# Altium schematic sheet STLink.SchDoc
size A4; SheetNumber: 3; SheetTotal: 7
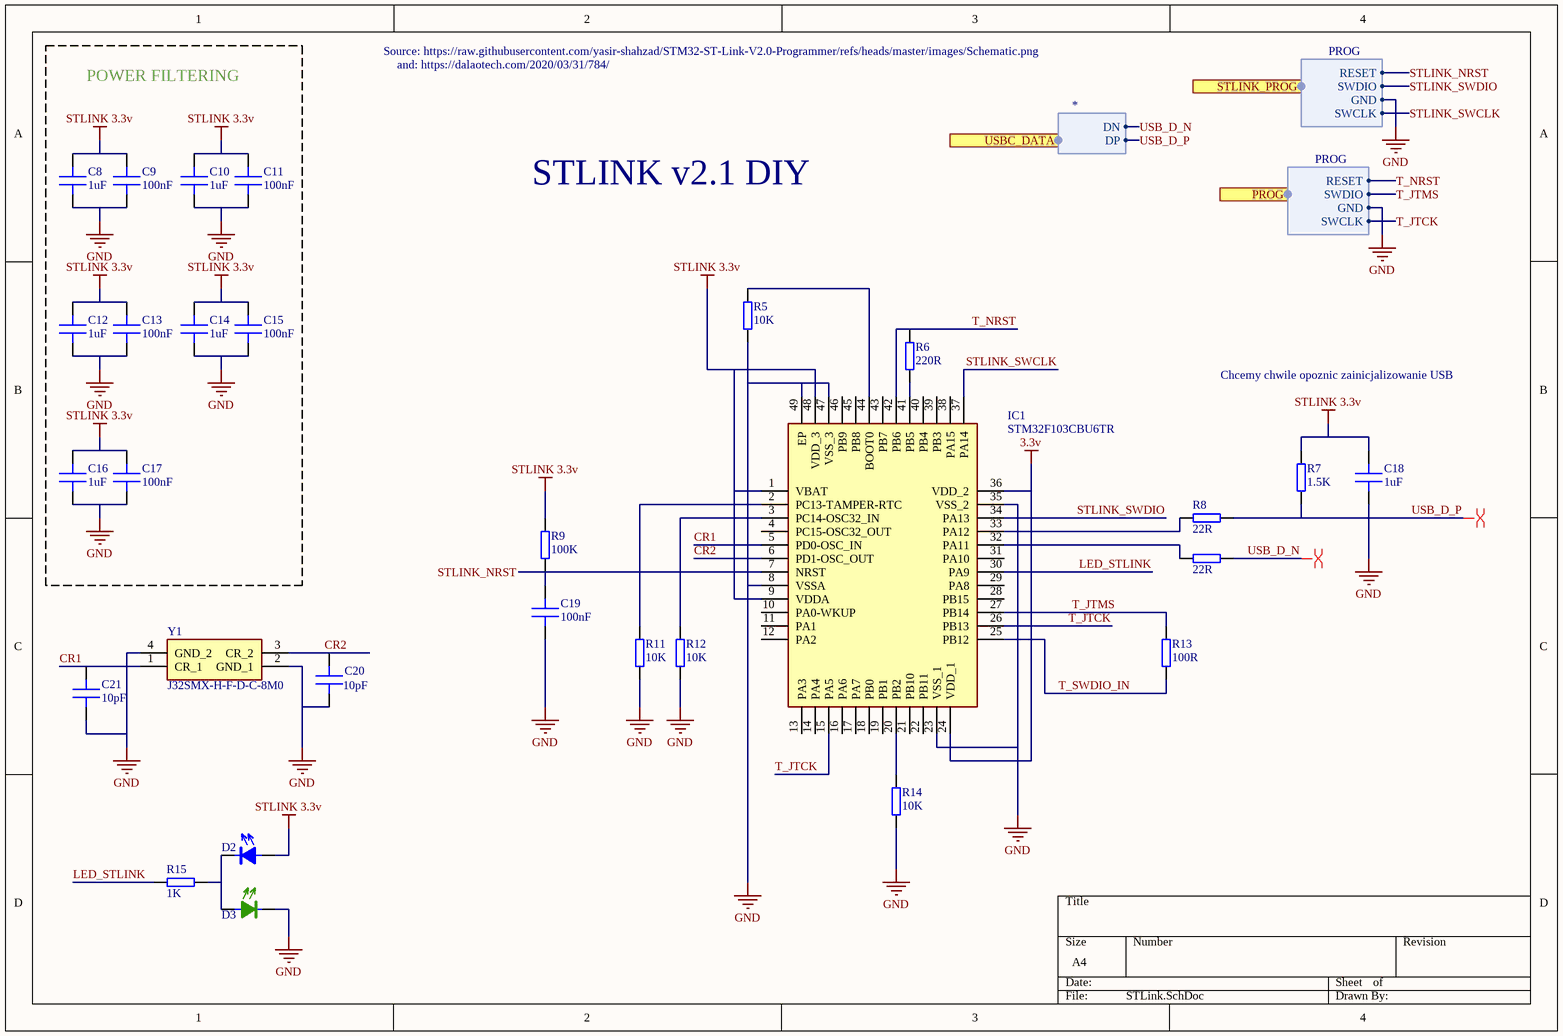
[diagram p0: STLink.SchDoc]

## Parts
C8  1uF  [C 0402]
C9  100nF  [C 0402]
C10  1uF  [C 0402]
C11  100nF  [C 0402]
C12  1uF  [C 0402]
C13  100nF  [C 0402]
C14  1uF  [C 0402]
C15  100nF  [C 0402]
C16  1uF  [C 0402]
C17  100nF  [C 0402]
C18  1uF  [C 0402]
C19  100nF  [C 0402]
C20  10pF  [C 0402]
C21  10pF  [C 0402]
D2  LED BLUE  [LED 0603 BLUE]  (value not drawn)
D3  LED GREEN  [LED 0603 GREEN]  (value not drawn)
IC1  STM32F103CBU6TR  [QFN50P700X700X65-49N-D]
R5  10K  [R 0402]
R6  220R  [R 0402]
R7  1.5K  [R 0402]
R8  22R  [R 0402]
R9  100K  [R 0402]
R10  22R  [R 0402]
R11  10K  [R 0402]
R12  10K  [R 0402]
R13  100R  [R 0402]
R14  10K  [R 0402]
R15  1K  [R 0402]
Y1  J32SMX-H-F-D-C-8M0  [MCSJK7U1600101080B10]

## Blocks framed on the sheet
POWER FILTERING: C8-C17

## Ports
PROG (harness PROG), STLINK_PROG (harness PROG), USBC_DATA (harness *)

## Harnesses
PROG: RESET, SWDIO, GND, SWCLK
*: DN, DP

## Nets
3.3v: IC1.24(VDD_1) IC1.36(VDD_2)
GND: C8.2 C9.2 C10.2 C11.2 C12.2 C13.2 C14.2 C15.2 C16.2 C17.2 C18.2 C19.2 C20.2 C21.2 D3.2 IC1.8(VSSA) IC1.23(VSS_1) IC1.35(VSS_2) IC1.47(VSS_3) IC1.49(EP) R5.1 R11.1 R12.1 R14.1 Y1.2(GND_1) Y1.4(GND_2) ; port PROG.GND, port STLINK_PROG.GND
STLINK 3.3v: C8.1 C9.1 C10.1 C11.1 C12.1 C13.1 C14.1 C15.1 C16.1 C17.1 C18.1 D2.1 IC1.1(VBAT) IC1.9(VDDA) IC1.48(VDD_3) R7.2 R9.2
CR1: C21.1 IC1.5(PD0-OSC_IN) Y1.1(CR_1)
CR2: C20.1 IC1.6(PD1-OSC_OUT) Y1.3(CR_2)
LED_STLINK: IC1.30(PA9) R15.1
STLINK_NRST: C19.1 IC1.7(NRST) R9.1 ; port STLINK_PROG.RESET
STLINK_SWCLK: IC1.37(PA14) ; port STLINK_PROG.SWCLK
STLINK_SWDIO: IC1.34(PA13) ; port STLINK_PROG.SWDIO
T_JTCK: IC1.15(PA5) IC1.26(PB13) ; port PROG.SWCLK
T_JTMS: IC1.27(PB14) R13.2 ; port PROG.SWDIO
T_NRST: IC1.42(PB6) R6.2 ; port PROG.RESET
T_SWDIO_IN: IC1.25(PB12) R13.1
USB_D_N: R10.1 ; port USBC_DATA.DN
USB_D_P: R7.1 R8.1 ; port USBC_DATA.DP
NetD2_2: D2.2 D3.1 R15.2
NetIC1_2: IC1.2(PC13-TAMPER-RTC) R11.2
NetIC1_3: IC1.3(PC14-OSC32_IN) R12.2
NetIC1_20: IC1.20(PB2) R14.2
NetIC1_32: IC1.32(PA11) R10.2
NetIC1_33: IC1.33(PA12) R8.2
NetIC1_41: IC1.41(PB5) R6.1
NetIC1_44: IC1.44(BOOT0) R5.2

Not connected (* = marked no-connect by the designer): IC1 4(PC15-OSC32_OUT) 10(PA0-WKUP) 11(PA1) 12(PA2) 13(PA3) 14(PA4) 16(PA6) 17(PA7) 18(PB0) 19(PB1) 21(PB10) 22(PB11) 28(PB15) 29(PA8) 31(PA10) 38(PA15) 39(PB3) 40(PB4) 43(PB7) 45(PB8) 46(PB9)

## Layout directives
differential pair: USB_D_N, USB_D_P

## Notes on the sheet
- Source: https://raw.githubusercontent.com/yasir-shahzad/STM32-ST-Link-V2.0-Programmer/refs/heads/master/images/Schematic.png
- and: https://dalaotech.com/2020/03/31/784/
- STLINK v2.1 DIY
- Chcemy chwile opoznic zainicjalizowanie USB

## Library data of the parts
C8-C21 = Capacitor: MLCC Capacitor
IC1 = STM32F103CBU6TR: Integrated Circuit; Manufacturer_Name: STMicroelectronics; Datasheet Link: https://www.st.com/resource/en/datasheet/stm32f103c8.pdf; Height: 0.65mm; Manufacturer_Part_Number: STM32F103CBU6TR; Mouser Part Number: 511-STM32F103CBU6TR; Mouser Price/Stock: https://www.mouser.co.uk/ProductDetail/STMicroelectronics/STM32F103CBU6TR?qs=9MuLHSklicqxG7WqISeIlA%3D%3D; Arrow Part Number: STM32F103CBU6TR; Arrow Price/Stock: https://www.arrow.com/en/products/stm32f103cbu6tr/stmicroelectronics
R5-R15 = Resistor: General pourpouse resistor
Y1 = MCSJK-7U-16.00-10-10-80-B-10: Crystal or Oscillator; Manufacturer_Name: Multicomp Pro; Datasheet Link: https://componentsearchengine.com/Datasheets/2/MCSJK-7U-16.00-10-10-80-B-10.pdf; Height: 0.8mm; Manufacturer_Part_Number: MCSJK-7U-16.00-10-10-80-B-10